# EAGLE schematic Schematic (EAGLE 9.7.0)
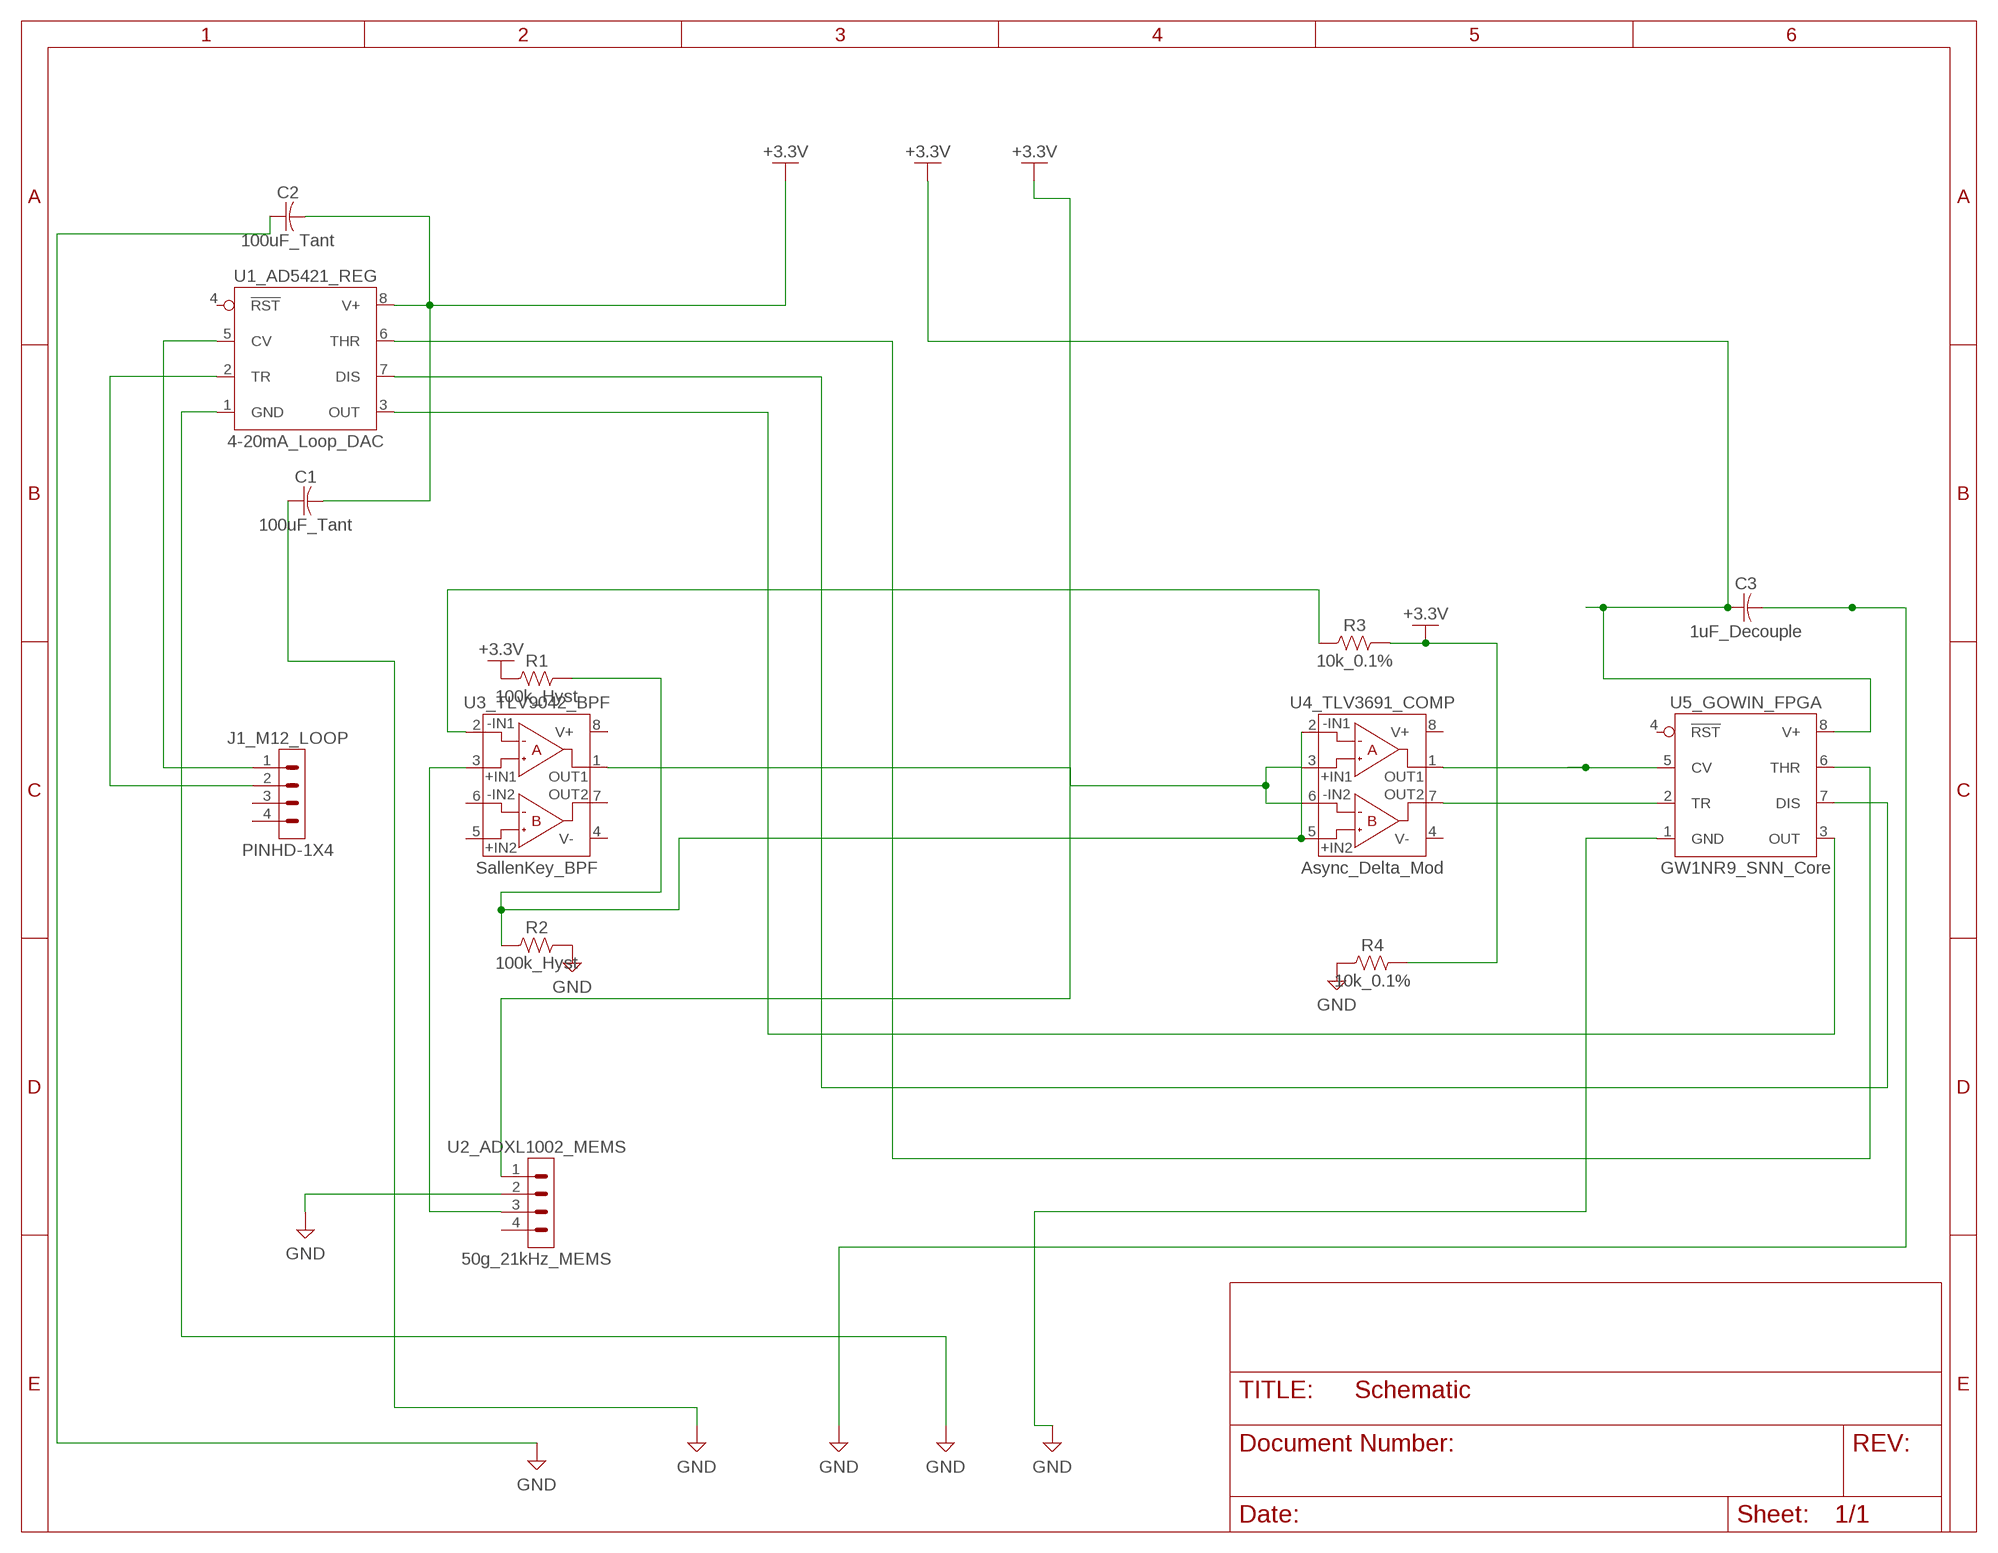
[diagram p0: schematic, sheet 1]

## Parts
C1  100uF_Tant  C-US_CHIP-0402(1005-METRIC)  [CAPC1005X60]
C2  100uF_Tant  C-US_CHIP-0402(1005-METRIC)  [CAPC1005X60]
C3  1uF_Decouple  C-US_CHIP-0402(1005-METRIC)  [CAPC1005X60]
J1_M12_LOOP  PINHD-1X4  [1X04]
R1  100k_Hyst  R-US_CHIP-0402(1005-METRIC)  [RESC1005X40]
R2  100k_Hyst  R-US_CHIP-0402(1005-METRIC)  [RESC1005X40]
R3  10k_0.1%  R-US_CHIP-0402(1005-METRIC)  [RESC1005X40]
R4  10k_0.1%  R-US_CHIP-0402(1005-METRIC)  [RESC1005X40]
U1_AD5421_REG  4-20mA_Loop_DAC  ICM7555_DIP  [DIP826W53P254L959H508Q8B]
U2_ADXL1002_MEMS  50g_21kHz_MEMS  PINHD-1X4  [1X04]
U3_TLV9042_BPF  SallenKey_BPF  LM358_SOIC  [SOIC127P600X175-8N]
U4_TLV3691_COMP  Async_Delta_Mod  LM358_SOIC  [SOIC127P600X175-8N]
U5_GOWIN_FPGA  GW1NR9_SNN_Core  ICM7555_DIP  [DIP826W53P254L959H508Q8B]

## Nets
+3.3V: C1.2 C2.2 C3.1 R1.1 R3.2 R4.2 U1_AD5421_REG.8(V+) U2_ADXL1002_MEMS.1 U5_GOWIN_FPGA.8(V+)
GND: C1.1 C2.1 C3.2 R2.2 R4.1 U1_AD5421_REG.1(GND) U2_ADXL1002_MEMS.2 U5_GOWIN_FPGA.1(GND)
N$1: J1_M12_LOOP.1 U1_AD5421_REG.5(CV)
N$2: J1_M12_LOOP.2 U1_AD5421_REG.2(TR)
N$3: U1_AD5421_REG.6(THR) U5_GOWIN_FPGA.6(THR)
N$4: U1_AD5421_REG.7(DIS) U5_GOWIN_FPGA.7(DIS)
N$5: U1_AD5421_REG.3(OUT) U5_GOWIN_FPGA.3(OUT)
N$6: U4_TLV3691_COMP.1(OUT1) U5_GOWIN_FPGA.5(CV)
N$7: U4_TLV3691_COMP.7(OUT2) U5_GOWIN_FPGA.2(TR)
N$8: U3_TLV9042_BPF.1(OUT1) U4_TLV3691_COMP.3(+IN1) U4_TLV3691_COMP.6(-IN2)
N$9: R1.2 R2.1 U4_TLV3691_COMP.2(-IN1) U4_TLV3691_COMP.5(+IN2)
N$10: U2_ADXL1002_MEMS.3 U3_TLV9042_BPF.3(+IN1)
N$11: R3.1 U3_TLV9042_BPF.2(-IN1)
Unconnected: J1_M12_LOOP.3 J1_M12_LOOP.4 U1_AD5421_REG.4(!RST) U2_ADXL1002_MEMS.4 U3_TLV9042_BPF.4(V-) U3_TLV9042_BPF.5(+IN2) U3_TLV9042_BPF.6(-IN2) U3_TLV9042_BPF.7(OUT2) U3_TLV9042_BPF.8(V+) U4_TLV3691_COMP.4(V-) U4_TLV3691_COMP.8(V+) U5_GOWIN_FPGA.4(!RST)

## Library data of the parts
C1-C3 = Capacitor:C-US: Capacitor - ANSI; CATEGORY_L1: Capacitor; CATEGORY_L2: Ceramic Capacitors; CATEGORY_L3: MLCC; PACKAGE: Surface Mount; PACKAGE_SIZE: 0402
J1_M12_LOOP U2_ADXL1002_MEMS = Connector:PINHD-1X4: Pin Header; CATEGORY_L1: Connectors; CATEGORY_L2: Headers; CATEGORY_L3: Male Pins; DESCRIPTION: Header-Straight-4 Position; PACKAGE: Through Hole; PITCH: 0.100" (2.54mm)
R1-R4 = Resistor:R-US: Resistor Fixed - ANSI; CATEGORY_L1: Resistors; DESCRIPTION: Chip Resistor 1.05 X 0.54 X 0.40 mm body 0402(1005-METRIC) Package; PACKAGE: Surface Mount; PACKAGE_SIZE: 0402
U1_AD5421_REG U5_GOWIN_FPGA = IC_Clock-Timing:*555: 555 General purpose precision timers NE555 : Texas Datasheet <http://www.ti.com/general/docs/suppproductinfo.tsp?distId=10&gotoUrl=http%3A%2F%2Fwww.ti.com%2Flit%2Fgpn%2Fne555> Diodes Incorporated Datasheet <https://www.diodes.com/assets/Datasheets/NE555_SA555_NA555.pdf> LM555 Datasheet <http://www.ti.com/general/docs/suppproductinfo.tsp?distId=10&gotoUrl=http%3A%2F%2Fwww.ti.com%2Flit%2Fgpn%2Flm555> LMC555 Datasheet <http://www.ti.com/general/docs/suppproductinfo.tsp?distId=10&gotoUrl=http%3A%2F%2Fwww.ti.com%2Flit%2Fgpn%2Flmc555> ICM7555 : Maxim Integrated Datasheet <https://datasheets.maximintegrated.com/en/ds/ICM7555-ICM7556.pdf> Renesas Electronics America Inc Datasheet <https://www.renesas.com/en-us/www/doc/datasheet/icm7555-56.pdf>; CATEGORY_L1: Clock/Timing; CATEGORY_L2: Programmable Timers and Oscillators; CATEGORY_L3: 555 Type Single Precision Timer; CURRENT_SUPPLY: 60 µA; DATASHEET: https://www.renesas.com/en/document/dst/icm7555-icm7556-datasheet; DESCRIPTION: 555 Type Timer/Oscillator (Single) IC 1 MHz 8-PDIP; FREQUENCY: 1 MHz; MANUFACTURER: Renesas Electronics Corporation; MPN: ICM7555IPAZ; OPERATING_TEMPERATURE: -25°C ~ 85°C; PACKAGE: Through Hole; PACKAGE_SIZE: 8-PDIP; PART_STATUS: Active; ROHS: Compliant; SERIES: ICM7555; VOLTAGE_SUPPLY: 2 V ~ 18 V
U3_TLV9042_BPF U4_TLV3691_COMP = IC_Linear:LM358: Dual Operational Amplifier Reference: Datasheet <https://www.ti.com/lit/ds/symlink/lm158-n.pdf>; CATEGORY_L1: Linear ICs; CATEGORY_L2: Amplifiers; CATEGORY_L3: General Purpose; DESCRIPTION: General Purpose Amplifier 2 Circuit 8-SOIC Generic; PACKAGE: Surface Mount; PACKAGE_SIZE: 8-SOIC; SERIES: LM358